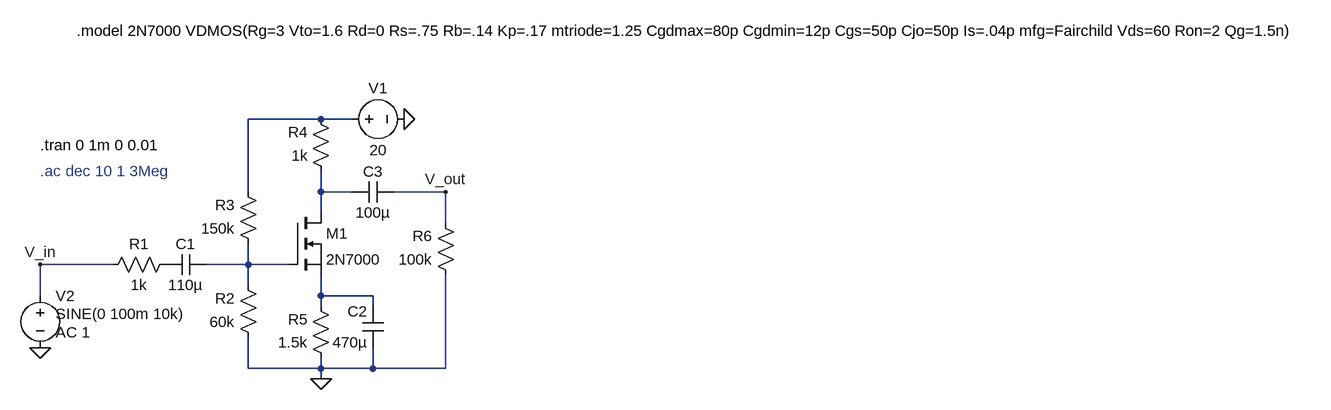
[diagram p0: schematic bonus.asc]
bonus.asc, the LTspice schematic file:
Version 4
SHEET 1 1948 680
WIRE 256 -32 144 -32
WIRE 304 -32 256 -32
WIRE 144 80 144 -32
WIRE 256 80 256 48
WIRE 304 80 256 80
WIRE 448 80 368 80
WIRE 256 112 256 80
WIRE 448 128 448 80
WIRE -64 192 -176 192
WIRE 144 192 144 160
WIRE 144 192 80 192
WIRE 208 192 144 192
WIRE 144 224 144 192
WIRE -176 240 -176 192
WIRE 256 240 256 208
WIRE 336 240 256 240
WIRE 256 256 256 240
WIRE 336 256 336 240
WIRE 144 352 144 304
WIRE 256 352 256 336
WIRE 256 352 144 352
WIRE 336 352 336 320
WIRE 336 352 256 352
WIRE 448 352 448 208
WIRE 448 352 336 352
WIRE 256 368 256 352
FLAG 256 368 0
FLAG 384 -32 0
FLAG -176 320 0
FLAG 448 80 V_out
FLAG -176 192 V_in
SYMBOL nmos 208 112 R0
SYMATTR InstName M1
SYMATTR Value 2N7000
SYMBOL res 32 176 R90
WINDOW 0 0 56 VBottom 2
WINDOW 3 32 56 VTop 2
SYMATTR InstName R1
SYMATTR Value 1k
SYMBOL res 160 320 R180
WINDOW 0 36 76 Left 2
WINDOW 3 36 40 Left 2
SYMATTR InstName R2
SYMATTR Value 60k
SYMBOL res 160 176 R180
WINDOW 0 36 76 Left 2
WINDOW 3 36 40 Left 2
SYMATTR InstName R3
SYMATTR Value 150k
SYMBOL res 272 64 R180
WINDOW 0 36 76 Left 2
WINDOW 3 36 40 Left 2
SYMATTR InstName R4
SYMATTR Value 1k
SYMBOL res 272 352 R180
WINDOW 0 36 76 Left 2
WINDOW 3 36 40 Left 2
SYMATTR InstName R5
SYMATTR Value 1.5k
SYMBOL res 464 224 R180
WINDOW 0 36 76 Left 2
WINDOW 3 36 40 Left 2
SYMATTR InstName R6
SYMATTR Value 100k
SYMBOL cap 80 176 R90
WINDOW 0 0 32 VBottom 2
WINDOW 3 32 32 VTop 2
SYMATTR InstName C1
SYMATTR Value 110µ
SYMBOL cap 352 320 R180
WINDOW 0 24 56 Left 2
WINDOW 3 24 8 Left 2
SYMATTR InstName C2
SYMATTR Value 470µ
SYMBOL cap 304 96 R270
WINDOW 0 32 32 VTop 2
WINDOW 3 0 32 VBottom 2
SYMATTR InstName C3
SYMATTR Value 100µ
SYMBOL voltage 288 -32 R270
WINDOW 0 32 56 VTop 2
WINDOW 3 -32 56 VBottom 2
SYMATTR InstName V1
SYMATTR Value 20
SYMBOL voltage -176 224 R0
WINDOW 123 24 72 Left 2
WINDOW 39 0 0 Left 0
WINDOW 3 24 44 Left 2
SYMATTR Value2 AC 1
SYMATTR InstName V2
SYMATTR Value SINE(0 100m 10k)
TEXT -120 -168 Left 2 !.model 2N7000 VDMOS(Rg=3 Vto=1.6 Rd=0 Rs=.75 Rb=.14 Kp=.17 mtriode=1.25 Cgdmax=80p Cgdmin=12p Cgs=50p Cjo=50p Is=.04p mfg=Fairchild Vds=60 Ron=2 Qg=1.5n)
TEXT -176 8 Left 2 !.tran 0 1m 0 0.01
TEXT -176 48 Left 2 ;.ac dec 10 1 3Meg

The netlist it stands for:
* bonus.asc
M1 N002 N003 N004 N004 2N7000
R1 P001 V_in 1k
R2 0 N003 60k
R3 N003 N001 150k
R4 N002 N001 1k
R5 0 N004 1.5k
R6 0 V_out 100k
C1 N003 P001 110µ
C2 0 N004 470µ
C3 N002 V_out 100µ
V1 N001 0 20
V2 V_in 0 SINE(0 100m 10k) AC 1
.model NMOS NMOS
.model PMOS PMOS
.lib standard.mos
.model 2N7000 VDMOS(Rg=3 Vto=1.6 Rd=0 Rs=.75 Rb=.14 Kp=.17 mtriode=1.25 Cgdmax=80p Cgdmin=12p Cgs=50p Cjo=50p Is=.04p mfg=Fairchild Vds=60 Ron=2 Qg=1.5n)
.tran 0 1m 0 0.01
* .ac dec 10 1 3Meg
.backanno
.end